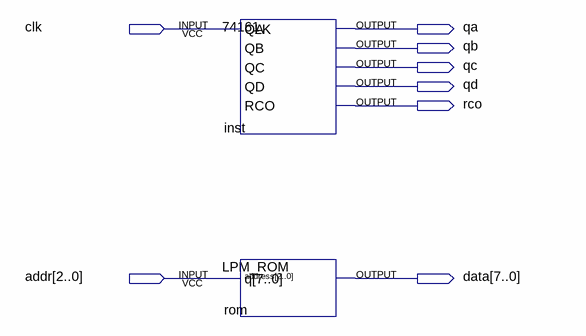
[diagram p0: schematic sheet]
// Quartus schematic parts.bdf as structural Verilog: 2 symbols, 8 pins
module parts (
  input  clk,
  input  [2:0] addr,
  output qa,
  output qb,
  output qc,
  output qd,
  output rco,
  output [7:0] data
);

  \74161  inst (.CLK(clk), .QA(qa), .QB(qb), .QC(qc), .QD(qd), .RCO(rco));
  LPM_ROM #(.LPM_WIDTH(8), .LPM_WIDTHAD(3), .LPM_FILE("rom.mif"), .LPM_ADDRESS_CONTROL("UNREGISTERED"), .LPM_OUTDATA("UNREGISTERED")) rom (
    .address(addr), .q(data));
endmodule
